# EasyEDA Pro project 集成板.eprj, board 指示面板(省赛)
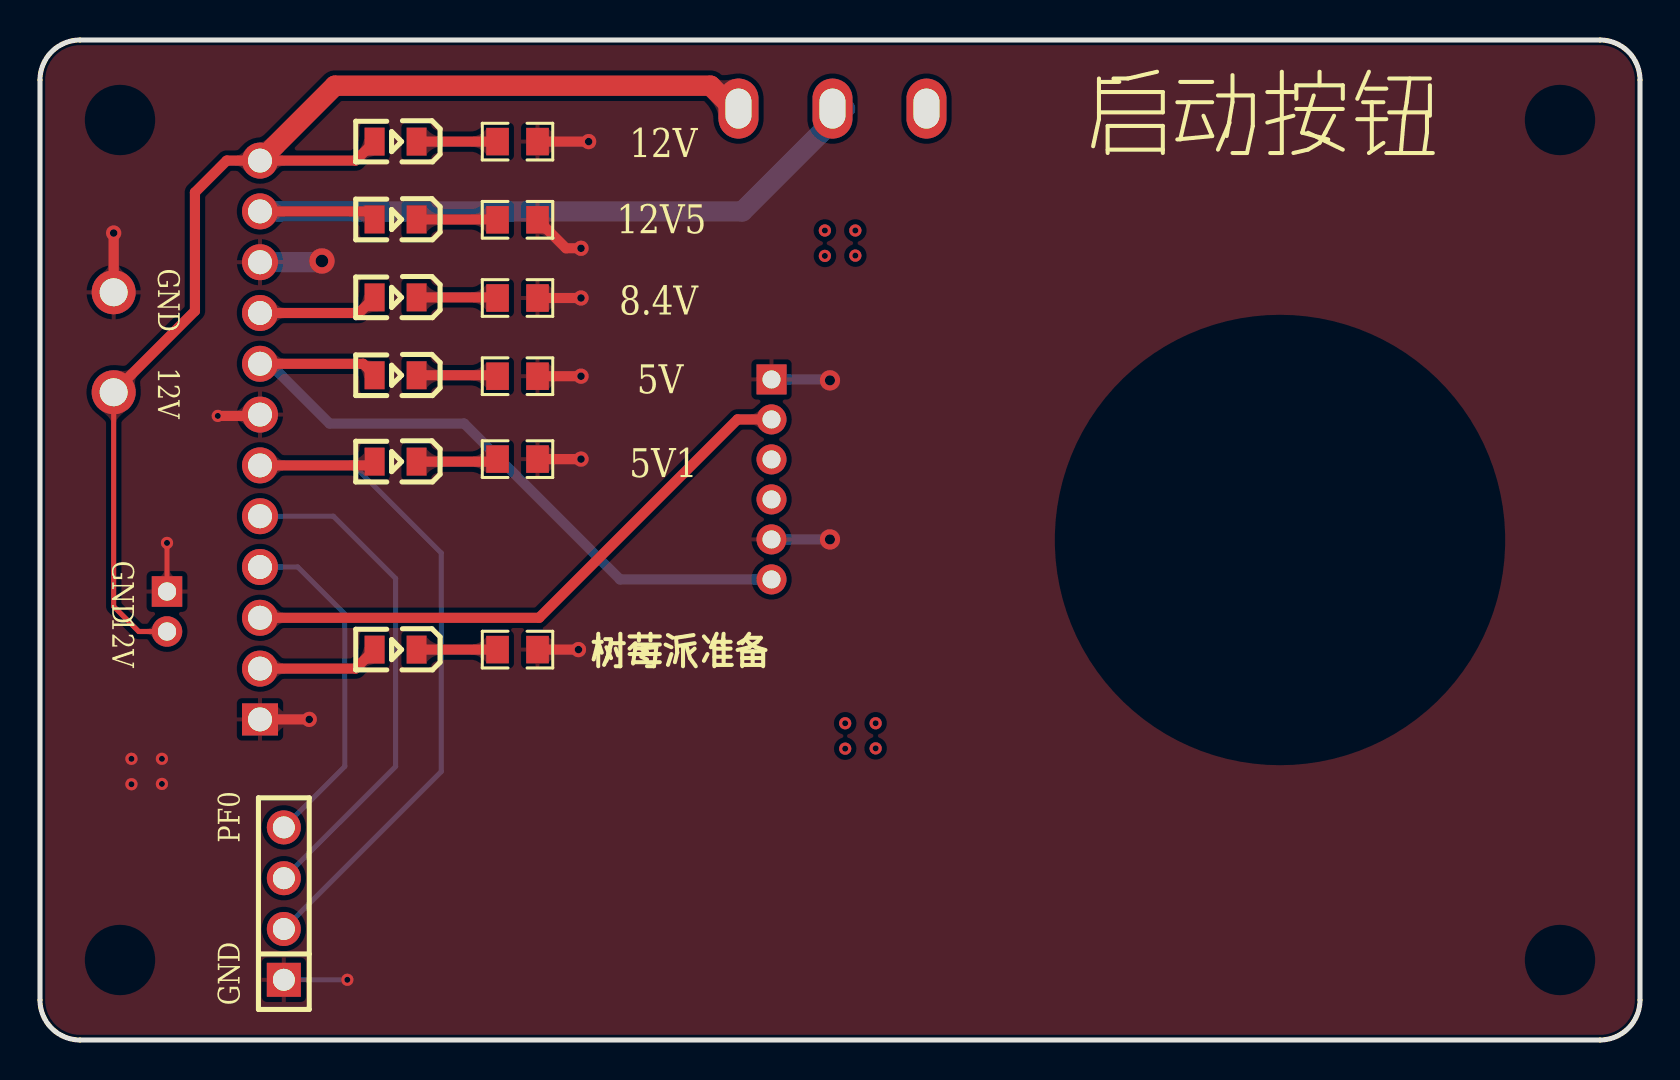
[diagram p6: board, top side]
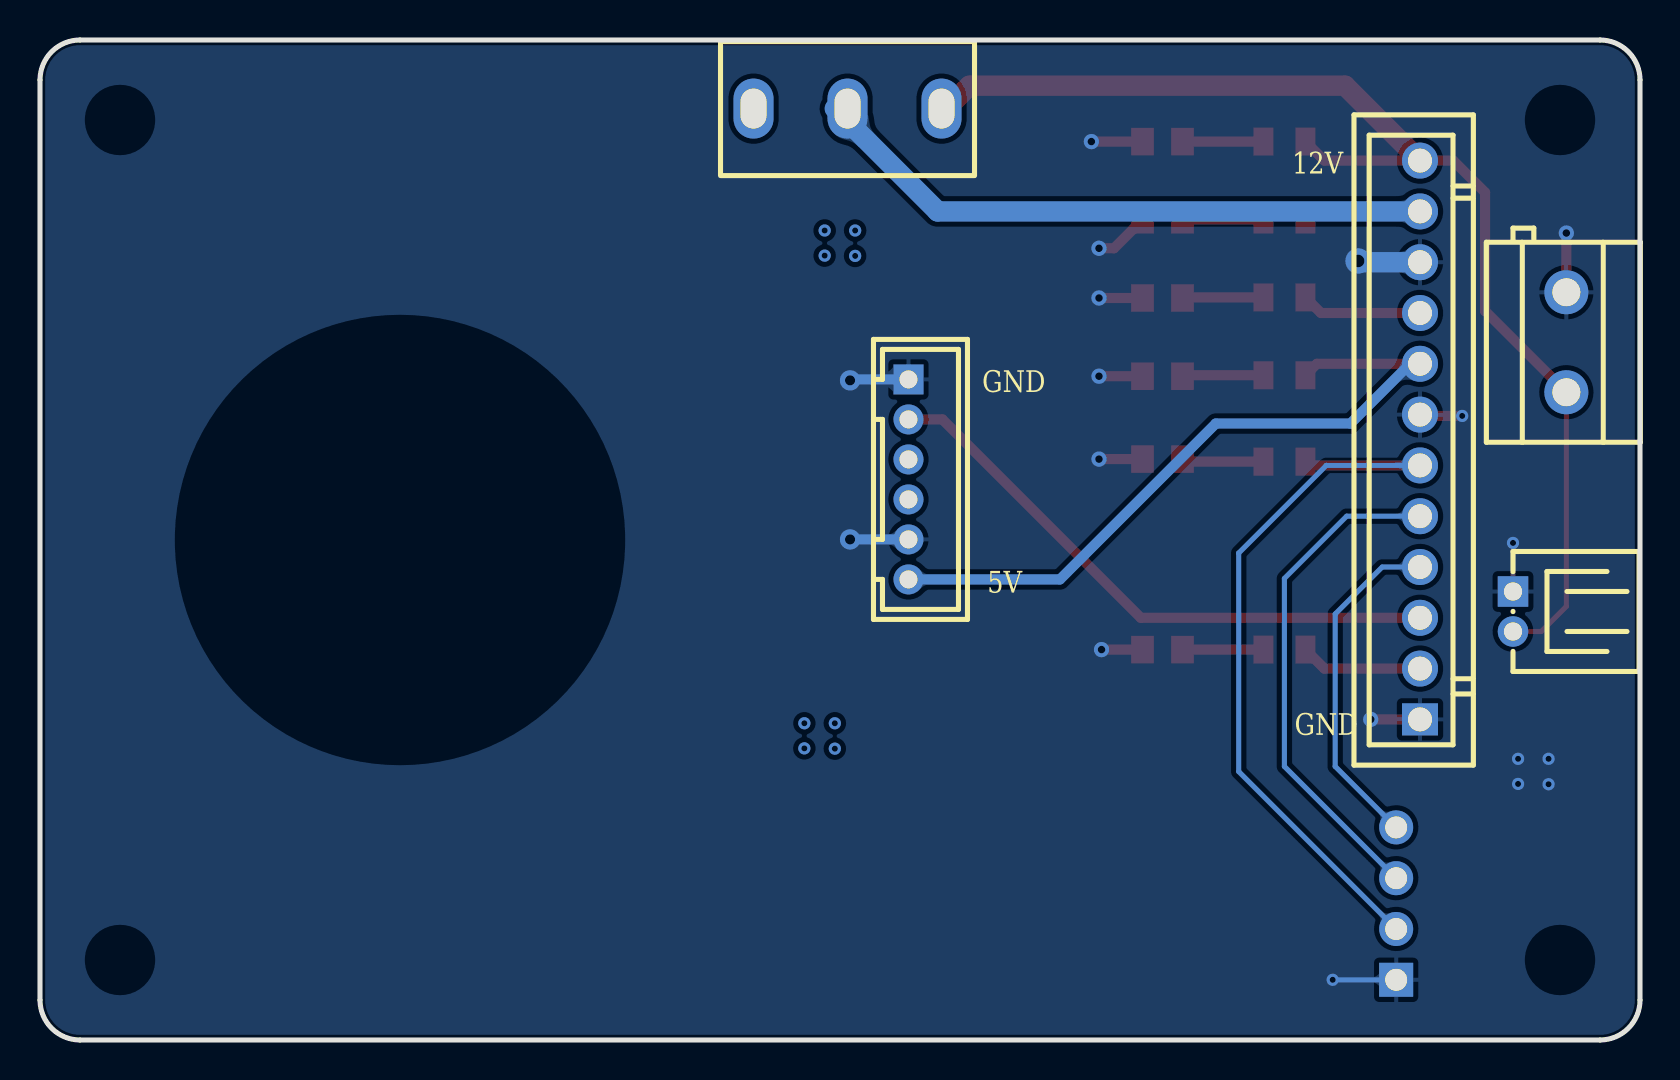
[diagram p7: board, bottom side, seen from below]

Outline 80 x 50 mm; copper layers: Top Layer, Bottom Layer. Coordinates in mm from the lower left corner of the outline.
Outline path: 0,48 0,2 arc(0.59,0.59) 2,0 78,0 arc(79.41,0.59) 80,2 80,48 arc(79.41,49.41) 78,50 2,50 arc(0.59,49.41) 0,48
Stack: Top Layer 0.035mm / Dielectric1 1.51mm FR4 er 4.5 / Bottom Layer 0.035mm

## Design rules (mm)
template: JLCPCB Capability(Two Layers Board)
spacing copperThickness1oz (default): track to track 0.102, other pairs 0.152 to 0.3
spacing copperThickness2oz: track to track 0.203, other pairs 0.152 to 0.3
track width copperThickness1oz (default): min 0.127, default 0.254, max 2.54
track width copperThickness2oz: min 0.203, default 0.254, max 2.54
differential pair differentialPair (default): width min 0.127, default 0.254, max 2.54; gap min 0.152, default 0.152
via viaSize (default): diameter min 0.5, default 0.61, max 10; hole min 0.3, default 0.305, max 6.3

## Placement (name value [footprint] x y rotation side)
CN10  PH-6A  [CONN-TH_6P-P2.00_PH-6A_C2908627]  36.58 28.03 270 bottom
H7  2.54-1*4P母  [HDR-TH_4P-P2.54-V-F]  12.19 6.82 90 top
LED4  NCD0805G1  [LED0805-R-RD]  17.78 33.24 180 top
LED5  NCD0805G1  [LED0805-R-RD]  17.78 37.13 180 top
LED7  NCD0805G1  [LED0805-R-RD]  17.78 44.92 180 top
LED8  NCD0805G1  [LED0805-R-RD]  17.78 41.03 180 top
LED9  NCD0805G1  [LED0805-R-RD]  17.78 19.52 180 top
LED10  NCD0805G1  [LED0805-R-RD]  17.78 28.92 180 top
R7  3kΩ  [R0805]  23.88 44.92 180 top
R8  3kΩ  [R0805]  23.88 37.1 180 top
R9  3kΩ  [R0805]  23.88 33.19 180 top
R10  3kΩ  [R0805]  23.88 41.01 180 top
R11  3kΩ  [R0805]  23.88 19.52 180 top
R12  3kΩ  [R0805]  23.88 29.05 180 top
SW1  SS-12D10L5  [SW-TH_SS-12D10L5]  39.62 46.57 0 bottom
U15  KF301-5.0-2P  [CONN-TH_P5.00_KF301-5.0-2P]  3.68 34.89 90 bottom
U20  WAFER-PH2.0-2PWZ  [CONN-TH_2P-P2.00_GP01-2001WR-2P]  6.35 21.42 270 bottom
U43  ZX-XH2.54-12PZZ  [CONN-TH_12P-P2.54_ZX-XH2.54-12PZZ]  11 30 90 bottom

## Footprints (pads in the part's own frame, mm; a bottom-side part is the same pattern mirrored in y, then rotated)
CONN-TH_2P-P2.00_GP01-2001WR-2P
  rect 1.524x1.524 hole 0.914: 1(-1,0)
  round 1.524 hole 0.914: 2(1,0)
CONN-TH_6P-P2.00_PH-6A_C2908627
  rect 1.5x1.5 hole 0.9: 1(-5,0)
  round 1.5 hole 0.9: 2(-3,0) 3(-1,0) 4(1,0) 5(3,0) 6(5,0)
CONN-TH_12P-P2.54_ZX-XH2.54-12PZZ
  rect 1.6x1.8 hole 1.2: 1(-13.97,0)
  round 1.8 hole 1.2: 2(-11.43,0) 3(-8.89,0) 4(-6.35,0) 5(-3.81,0) 6(-1.27,0) 7(1.27,0) 8(3.81,0) 9(6.35,0) 10(8.89,0) 11(11.43,0) 12(13.97,0)
CONN-TH_P5.00_KF301-5.0-2P
  round 2.2 hole 1.4: 1(-2.5,0) 2(2.5,0)
HDR-TH_4P-P2.54-V-F
  rect 1.7x1.7 hole 1.1: 1(-3.81,0)
  round 1.7 hole 1.1: 2(-1.27,0) 3(1.27,0) 4(3.81,0)
LED0805-R-RD
  rect 1x1.399 smd: 1(1.05,0) 2(-1.05,0)
R0805
  rect 1.133x1.377 smd: 1(-1,0) 2(1,0)
SW-TH_SS-12D10L5
  oval 2x3 hole 1.3x2: 1(-4.7,0) 2(0,0) 3(4.7,0)

## Nets
As in the schematic.

## Via types
v1: diameter 0.61, hole 0.305, Top Layer to Bottom Layer, 15 vias
v2: diameter 0.762, hole 0.381, Top Layer to Bottom Layer, 8 vias
v3: diameter 1.016, hole 0.508, Top Layer to Bottom Layer, 2 vias
v4: diameter 1.27, hole 0.635, Top Layer to Bottom Layer, 1 via

## Routing (per net, layer and track width the routed paths; a pad name or vN(x,y) marks a point on that pad's centre or on a via; arc(x,y) is an arc through that point)
5V: length 36
  Top Layer w0.508: U43.8 16.16,33.81 LED4.1
  Bottom Layer w0.508: CN10.6 29,23.03 21.21,30.82 14.48,30.82 11.49,33.81 U43.8
5V1: length 38.7
  Top Layer w0.508: LED10.1 16.54,28.73 U43.6
  Bottom Layer w0.254: H7.2 20.07,13.42 20.07,24.35 15.68,28.73 U43.6
8.4V: length 6.1
  Top Layer w0.508: LED5.1 15.95,36.35 U43.9
12V: length 61.3
  Top Layer w0.254: U15.1 3.68,21.68 4.94,20.42 U20.2
  Top Layer w0.508: LED7.1 15.78,43.97 U43.12 9.34,43.97 7.75,42.38 7.75,36.45 U15.1
  Top Layer w1.016: 34.67,46.57 33.53,47.71 14.74,47.71 U43.12
12V5: length 37.3
  Top Layer w0.508: LED8.1 16.33,41.43 U43.11
  Bottom Layer w1.016: 40.26,46.57 35.12,41.43 U43.11
GND: length 36.1
  Top Layer w0.254: U20.1 v1(6.35,24.85)
  Top Layer w0.508: U43.7 10.93,31.2 v1(8.89,31.2) ; v2(27.05,39.59) 26.3,39.59 R10.1 ; U15.2 v2(3.68,40.35) ; R11.1 v2(26.92,19.52) ; R12.1 v2(27.05,29.05) ; U43.1 v2(13.46,16.03) ; R7.1 v2(27.43,44.92) ; R8.1 v2(27.05,37.1) ; R9.1 v2(27.05,33.19)
  Bottom Layer w0.254: H7.1 v1(15.37,3.01)
  Bottom Layer w0.508: v3(39.5,32.98) 39.45,33.03 CN10.1 ; CN10.5 v3(39.5,25.03)
  Bottom Layer w1.016: v4(14.1,38.95) 14.1,38.89 U43.10
  vias: v1(4.57,14.06) v1(4.57,12.79) v1(6.1,14.06) v1(6.1,12.8)
(no net):
  vias: v1(39.24,40.47) v1(39.24,39.2) v1(40.26,15.84) v1(40.26,14.57) v1(40.77,40.47) v1(40.77,39.22) v1(41.78,15.84) v1(41.78,14.58)
PA8: length 6.1
  Top Layer w0.508: LED9.1 15.78,18.57 U43.2
PC9: length 29.7
  Top Layer w0.508: CN10.2 34.88,31.03 24.96,21.11 U43.3
PF0: length 17.1
  Bottom Layer w0.254: U43.4 12.89,23.65 15.24,21.3 15.24,13.68 H7.4
PF1: length 25.4
  Bottom Layer w0.254: U43.5 14.67,26.19 17.78,23.08 17.78,13.68 H7.3
$1N359: length 4
  Top Layer w0.508: LED7.2 R7.2
$1N361: length 4.1
  Top Layer w0.508: LED5.2 22.85,37.13 R8.2
$1N363: length 4.1
  Top Layer w0.508: R9.2 22.83,33.24 LED4.2
$1N652: length 4.1
  Top Layer w0.508: LED8.2 22.86,41.03 R10.2
$1N753: length 4
  Top Layer w0.508: LED9.2 R11.2
$1N1527: length 4.1
  Top Layer w0.508: R12.2 22.75,28.92 LED10.2

## Copper pours and planes (outline as drawn; the poured copper is in the pictures)
GND on Top Layer: -7.37,53.17 93.73,53.17 93.73,-6.39 -7.37,-6.39
GND on Bottom Layer: -7.11,53.56 93.34,53.56 93.34,-6.13 -7.11,-6.13

Small or netless copper shapes (teardrops, artwork), in the pictures only: 52 on Top Layer, 18 on Bottom Layer

## Text on the board
Bottom Silkscreen Layer: GND | 12V | 5V
Top Silkscreen Layer: GND | 12V | PF0 | 树莓派准备 | 12V5 | 8.4V | 5V1 | 5V | 启动按钮
